# Altium schematic sheet MUTE_BUTTONS_A.SchDoc
size A4; SheetNumber: 7; SheetTotal: 8
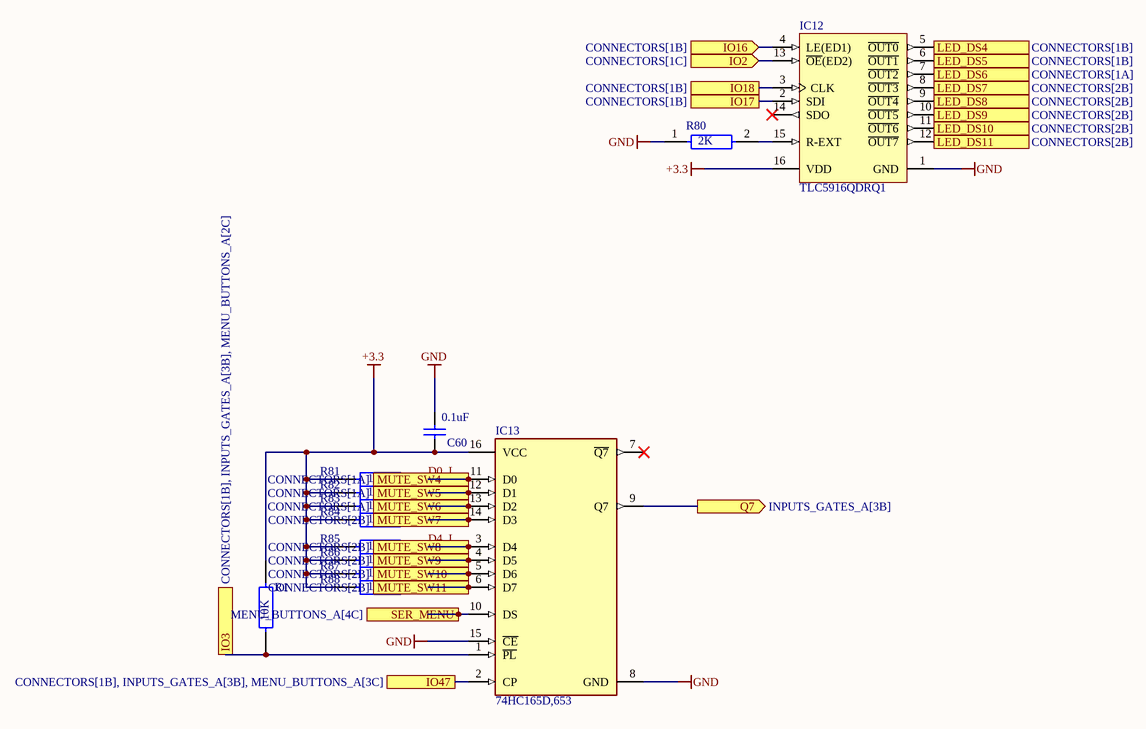
[diagram p0: MUTE_BUTTONS_A.SchDoc]

## Parts
C60  0.1uF  [CAPC2013X145X48NL20T23]
IC12  TLC5916QDRQ1  [D0016A_N]
IC13  74HC165D,653  [FP-SOT109-1-MFG]
R1  10K  [FP-RN73R2A-IPC_A]
R80  2K  [FP-RN73R2A-IPC_A]
R81  10K  [FP-RN73R2A-IPC_A]
R82  10K  [FP-RN73R2A-IPC_A]
R83  10K  [FP-RN73R2A-IPC_A]
R84  10K  [FP-RN73R2A-IPC_A]
R85  10K  [FP-RN73R2A-IPC_A]
R86  10K  [FP-RN73R2A-IPC_A]
R87  10K  [FP-RN73R2A-IPC_A]
R88  10K  [FP-RN73R2A-IPC_A]

## Ports
IO2 (in, see CONNECTORS[1C]), IO3 (see CONNECTORS[1B], INPUTS_GATES_A[3B], MENU_BUTTONS_A[2C]), IO16 (in, see CONNECTORS[1B]), IO17 (see CONNECTORS[1B]), IO18 (see CONNECTORS[1B]), IO47 (see CONNECTORS[1B], INPUTS_GATES_A[3B], MENU_BUTTONS_A[3C]), LED_DS4 (see CONNECTORS[1B]), LED_DS5 (see CONNECTORS[1B]), LED_DS6 (see CONNECTORS[1A]), LED_DS7 (see CONNECTORS[2B]), LED_DS8 (see CONNECTORS[2B]), LED_DS9 (see CONNECTORS[2B]), LED_DS10 (see CONNECTORS[2B]), LED_DS11 (see CONNECTORS[2B]), MUTE_SW4 (see CONNECTORS[1A]), MUTE_SW5 (see CONNECTORS[1A]), MUTE_SW6 (see CONNECTORS[1A]), MUTE_SW7 (see CONNECTORS[2B]), MUTE_SW8 (see CONNECTORS[2B]), MUTE_SW9 (see CONNECTORS[2B]), MUTE_SW10 (see CONNECTORS[2B]), MUTE_SW11 (see CONNECTORS[2B]), Q7 (out, see INPUTS_GATES_A[3B]), SER_MENU (in, see MENU_BUTTONS_A[4C])

## Nets
+3.3: C60.1 IC12.16(VDD) IC13.16(VCC) R1.2 R81.1 R82.1 R83.1 R84.1 R85.1 R86.1 R87.1 R88.1
GND: C60.2 IC12.1(GND) IC13.8(GND) IC13.15(~{CE}) R80.1
D0_L: IC13.11(D0) R81.2 ; port MUTE_SW4
D1_L: IC13.12(D1) R82.2 ; port MUTE_SW5
D2_L: IC13.13(D2) R83.2 ; port MUTE_SW6
D3_L: IC13.14(D3) R84.2 ; port MUTE_SW7
D4_L: IC13.3(D4) R85.2 ; port MUTE_SW8
D5_L: IC13.4(D5) R86.2 ; port MUTE_SW9
D6_L: IC13.5(D6) R87.2 ; port MUTE_SW10
D7_L: IC13.6(D7) R88.2 ; port MUTE_SW11
IO2: IC12.13(~{OE}(ED2)) ; port IO2
IO3: IC13.1(~{PL}) R1.1 ; port IO3
IO16: IC12.4(LE(ED1)) ; port IO16
IO17: IC12.2(SDI) ; port IO17
IO18: IC12.3(CLK) ; port IO18
IO47: IC13.2(CP) ; port IO47
LED_DS4: IC12.5(~{OUT0}) ; port LED_DS4
LED_DS5: IC12.6(~{OUT1}) ; port LED_DS5
LED_DS6: IC12.7(~{OUT2}) ; port LED_DS6
LED_DS7: IC12.8(~{OUT3}) ; port LED_DS7
LED_DS8: IC12.9(~{OUT4}) ; port LED_DS8
LED_DS9: IC12.10(~{OUT5}) ; port LED_DS9
LED_DS10: IC12.11(~{OUT6}) ; port LED_DS10
LED_DS11: IC12.12(~{OUT7}) ; port LED_DS11
Q7: IC13.9(Q7) ; port Q7
SER_MENU: IC13.10(DS) ; port SER_MENU
NetIC12_15: IC12.15(R-EXT) R80.2

Not connected (* = marked no-connect by the designer): IC12 14(SDO)*; IC13 7(~{Q7})*

## Library data of the parts
C60 = CAP: Manufacturer: Vitramon; Part Number: VJ0805Y682KXAMT
IC12 = TLC5916: Automotive Catalog 8-Bit Constant-Current LED Sink Drivers, 3 to 5.5 V, -40 to 125 degC, 16-pin SOIC (D16), Green (RoHS & no Sb/Br); Manufacturer: Texas Instruments; SubFamily: LED Driver; Vin(Max)(V): 5.5; Vin(Min)(V): 3; Iout(Max)(A): 0.12; DatasheetVersion: SLVS814; Mounting Technology: Surface Mount; ComponentLink3Description: Package Specification; PartNumber: TLC5916QDRQ1; ComponentLink1Description: Manufacturer URL; Eco-Plan: Green (RoHS & no Sb/Br); Code_JEDEC: MS-012; ComponentLink2URL: http://www.ti.com/general/docs/lit/getliterature.tsp?genericPartNumber=TLC5916-Q1&fileType=pdf; PackageDescription: 16-Pin Plastic Small Outline, Body 9.90 x 3.90 mm, Pitch 1.27 mm; ComponentLink2Description: Datasheet; ComponentLink3URL: http://www.ti.com/litv/pdf/mpds178g; ComponentLink1URL: http://www.ti.com/; PackageVersion: 4040047-6/M; PackageReference: D0016A
IC13 = 74HC165: IC SHIFT REGST 8BIT PI-SO 16SOIC; Manufacturer: Nexperia; Standoff Height: 0.1mm; Number Of Inputs: 8; Logic Function Desc: Shift Register; Nominal Supply Current: 8uA; Number Of Circuits: 1; Propagation Delay: 15ns; Min Supply Voltage: 2V; Frequency: 61MHz; Max Supply Voltage: 6V; Height: 1.75mm; Digikey Description: IC SHIFT REGST 8BIT PI-SO 16SOIC; ComponentLink2URL: https://assets.nexperia.com/documents/data-sheet/74HC_HCT165.pdf; Ipc Land Pattern Name: SOP127P600X175-16; Temperature Range High: +125°C; Manufacturer Part Number: 74HC165D,653; Temperature: -40°C to +125°C; Device Class L2: Logic ICs; Device Class L1: Integrated Circuits (ICs); Lead Free: Yes; Number Of Outputs: 1; Ambient Temperature Range High: +125°C; ComponentLink2Description: Datasheet; Temperature Range Low: -40°C; Category: IC; RoHS: TRUE; Automotive: No; Device Class L3: Shift Registers; Octopart: https://octopart.com/74hc165d%2C653-nexperia-78737091; Footprint Url: https://assets.nexperia.com/documents/outline-drawing/SOT109-1.pdf; Ambient Temperature Range Low: -40°C; Package: SOT109-1
R1 R80-R88 = Resistor: RES 10K OHM 0.1% 1/8W 0805